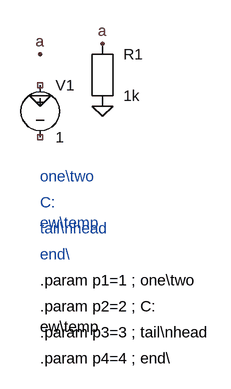
[diagram p0: schematic text_backslash.asc]
text_backslash.asc, the LTspice schematic file:
Version 4
SHEET 1 880 680
FLAG 0 112 a
FLAG 0 176 0
FLAG 96 96 a
FLAG 96 192 0
SYMBOL voltage 0 144 R0
SYMATTR InstName V1
SYMATTR Value 1
SYMBOL res 96 144 R0
SYMATTR InstName R1
SYMATTR Value 1k
TEXT 0 300 Left 2 ;one\\two
TEXT 0 340 Left 2 ;C:\new\temp
TEXT 0 380 Left 2 ;tail\\nhead
TEXT 0 420 Left 2 ;end\
TEXT 0 460 Left 2 !.param p1=1 ; one\\two
TEXT 0 500 Left 2 !.param p2=2 ; C:\new\temp
TEXT 0 540 Left 2 !.param p3=3 ; tail\\nhead
TEXT 0 580 Left 2 !.param p4=4 ; end\

The netlist it stands for:
* text_backslash.asc
V1 NC_01 NC_02 1
R1 a 0 1k
* one\two
* C:
* ew\temp
* tail\nhead
* end\
.param p1=1 ; one\two
.param p2=2 ; C:
ew\temp
.param p3=3 ; tail\nhead
.param p4=4 ; end\
.backanno
.end